# Altium schematic sheet Power_Sheet.SchDoc
size A4; SheetNumber: 1; SheetTotal: 4
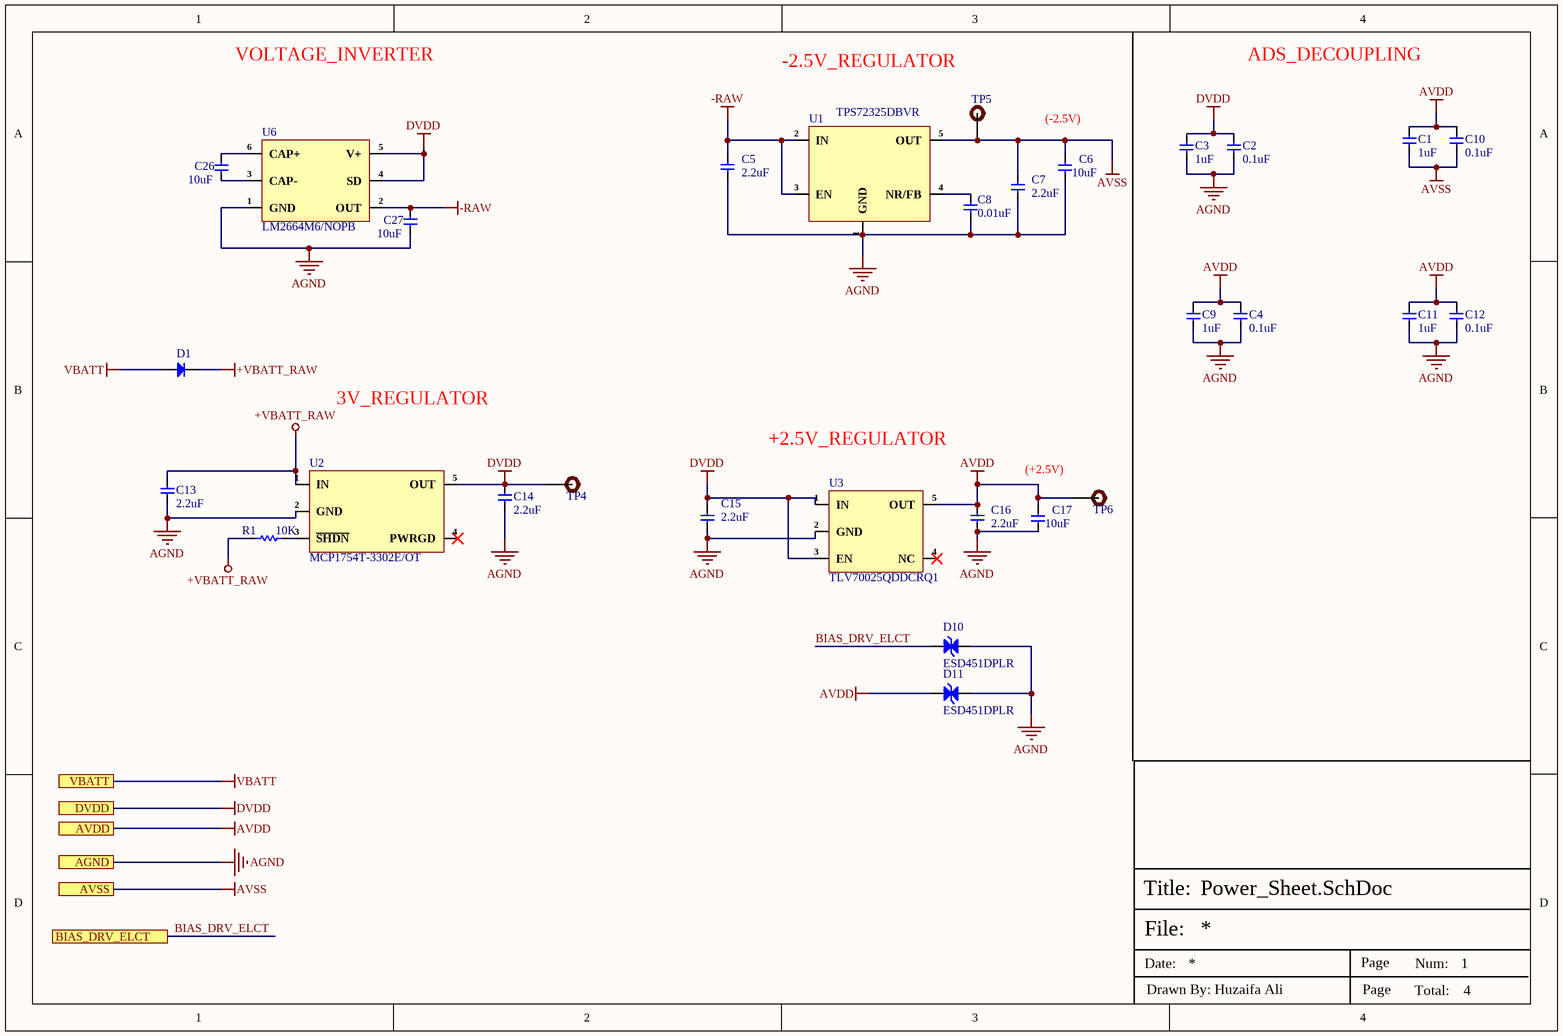
[diagram p0: Power_Sheet.SchDoc]

## Parts
C1  1uF  [Cap-0402]
C2  0.1uF  [Cap-0402]
C3  1uF  [Cap-0402]
C4  0.1uF  [Cap-0402]
C5  2.2uF  [Cap-0402]
C6  10uF  [Cap-0402]
C7  2.2uF  [Cap-0402]
C8  0.01uF  [Cap-0402]
C9  1uF  [Cap-0402]
C10  0.1uF  [Cap-0402]
C11  1uF  [Cap-0402]
C12  0.1uF  [Cap-0402]
C13  2.2uF  [Cap-0402]
C14  2.2uF  [Cap-0402]
C15  2.2uF  [Cap-0402]
C16  2.2uF  [Cap-0402]
C17  10uF  [Cap-0402]
C26  10uF  [Cap-0402]
C27  10uF  [Cap-0402]
D1  CDBU0130L  [CDBU0130L-HF]  (value not drawn)
D10  ESD451DPLR  [X2SON-2(0.3x0.6)]
D11  ESD451DPLR  [X2SON-2(0.3x0.6)]
R1  10K  [Res-0402]
TP4  TEST POINT 0.5mm Dia  [Test-point - 0.5mm]  (value not drawn)  (no BOM)
TP5  TEST POINT 0.5mm Dia  [Test-point - 0.5mm]  (value not drawn)  (no BOM)
TP6  TEST POINT 0.5mm Dia  [Test-point - 0.5mm]  (value not drawn)  (no BOM)
U1  TPS72325DBVR  [SOT-23-5]
U2  MCP1754T-3302E/OT  [SOT-23-5]
U3  TLV70025QDDCRQ1  [SOT-23-5]
U6  LM2664M6/NOPB  [SOT-23-6]

## Ports
AGND, AVDD, AVSS, BIAS_DRV_ELCT, DVDD, VBATT

## Nets
+VBATT_RAW: C13.1 D1.2(K) R1.1 U2.1(IN)
-RAW: C5.1 C27.2 U1.2(IN) U1.3(EN) U6.2(OUT)
AGND: C2.1 C3.1 C4.1 C5.2 C6.1 C7.2 C8.2 C9.1 C11.1 C12.1 C13.2 C14.2 C15.2 C16.2 C17.1 C27.1 D10.2(A) D11.2(A) U1.1(GND) U2.2(GND) U3.2(GND) U6.1(GND) ; port AGND
AVDD: C1.2 C4.2 C9.2 C10.2 C11.2 C12.2 C16.1 C17.2 D11.1(A) TP6.1 U3.5(OUT) ; port AVDD
AVSS: C1.1 C6.2 C7.1 C10.1 TP5.1 U1.5(OUT) ; port AVSS
DVDD: C2.2 C3.2 C14.1 C15.1 TP4.1 U2.5(OUT) U3.1(IN) U3.3(EN) U6.4(SD) U6.5(V+) ; port DVDD
VBATT: D1.1(A) ; port VBATT
BIAS_DRV_ELCT: D10.1(A) ; port BIAS_DRV_ELCT
NetC8_1: C8.1 U1.4(NR/FB)
NetC26_1: C26.1 U6.3(CAP-)
NetC26_2: C26.2 U6.6(CAP+)
NetR1_2: R1.2 U2.3(~{SHDN})

Not connected (* = marked no-connect by the designer): U2 4(PWRGD)*; U3 4(NC)*

## Notes on the sheet
- VOLTAGE_INVERTER
- -2.5V_REGULATOR
- ADS_DECOUPLING
- (near C6) (-2.5V)
- 3V_REGULATOR
- +2.5V_REGULATOR
- (+2.5V)
- File:
- Title:
- Date:
- Page
- Num:
- Total:
- Drawn By: Huzaifa Ali

## Library data of the parts
C1 C3 C9 C11 = CC0402KRX5R8BB105: CAP CER 1UF 25V X5R 0402; Manufacturer: Yageo; Tolerance: 10%; Supplier 1: Mouser; Manufacturer Part Number: CC0402KRX5R8BB105; RoHS: Yes; Category: Ceramic Capacitors; Stock 1: 91975; Pricing 1: 1=0.30000, 10=0.20400, 50=0.20400, 100=0.11600, 1000=0.07200, 10000=0.05900 (USD); Mount: Surface Mount; Case/Package: 0402; Case Code (Metric): 1005; Case Code (Imperial): 0402; Weight: 2.3E-05oz; Min Operating Temperature: -55°C; Max Operating Temperature: 85°C; Packaging: Tape and Reel; Capacitance: 1uF; Voltage Rating: 25V; Dielectric: X5R; Termination: SMD/SMT; Voltage Rating (DC): 25V; Package Quantity: 10000; Length: 0.039inch; Width: 0.02inch; Thickness: 0.022inch; Lead Free: Lead Free; Halogen Free: Halogen Free; RoHS Compliant: Yes; ComponentLink1URL: http://www.mouser.com/ds/2/447/Yageo_UPY-GP_NP0_16V-to-50V_9-358835.pdf?src-supplier=Mouser; ComponentLink1Description: http://www.mouser.com/ds/2/447/Yageo_UPY-GP_NP0_16V-to-50V_9-358835.pdf?src-supplier=Mouser; ComponentLink2URL: http://www.yageo.com/documents/recent/UPY-GPHC_X5R_4V-to-50V_25.pdf?src-supplier=Digi-Key; ComponentLink2Description: http://www.yageo.com/documents/recent/UPY-GPHC_X5R_4V-to-50V_25.pdf?src-supplier=Digi-Key; ComponentLink3URL: https://4donline.ihs.com/images/VipMasterIC/IC/YAGO/YAGO-S-A0006851646/YAGO-S-A0006851646-1.pdf?hkey=6D3A4C79FDBF58556ACFDE234799DDF0&src-supplier=Newark; ComponentLink3Description: https://4donline.ihs.com/images/VipMasterIC/IC/YAGO/YAGO-S-A0006851646/YAGO-S-A0006851646-1.pdf?hkey=6D3A4C79FDBF58556ACFDE234799DDF0&src-supplier=Newark; Supplier Part Number 1: 603-CC402KRX5R8BB105; LCSC Part Number: C326568
C2 C4 C10 C12 = CC0402KRX7R7BB104: CAP CER 0.1UF 16V X7R 0402; Manufacturer: Yageo; Item Type: Capacitors; Material: 4241ConductorMaterial; Tolerance: 10%; Value: 100nF; Temperature Coefficient: 30ppm/°C; Supplier: Future Electronics; LCSC Part Number: C60474; Manufacturer Part Number: CC0402KRX7R7BB104; RoHS: Yes; Stock: 22130000; Pricing: 10000=0.0021, 40000=0.002, 150000=0.0019, 250000=0.0019, 500000=0.0018 (USD); Mounting Technology: Surface Mount; Case/Package: 0402; Pins: 2; Case Code (Metric): 1005; Case Code (Imperial): 0402; Min Operating Temperature: -55°C; Max Operating Temperature: 125°C; Dielectric: X7R; Voltage Rating: 16V; Voltage Rating (DC): 16V; Packaging: Tape and Reel; Package Quantity: 1; Termination: SMD/SMT; Voltage: 16V; Series: CC; Voltage Rating (AC): 16V; Length: 1mm; Width: 0.02inch; Height: 0.5mm; Thickness: 0.022inch; Depth: 0.5mm; Radiation Hardening: No; RoHS Compliant: Yes; Reach SVHC Compliant: No; Halogen Free: 5694HalogenFree; Lead Free: 5697LeadFree; ComponentLink1URL: https://datasheet.ciiva.com/11788/0900766b80ce67ed-11788364.pdf?src-supplier=Rs; ComponentLink1Description: https://datasheet.ciiva.com/11788/0900766b80ce67ed-11788364.pdf?src-supplier=Rs; ComponentLink2URL: https://datasheet.ciiva.com/7978/1489800-7978111.pdf?src-supplier=Element14; ComponentLink2Description: https://datasheet.ciiva.com/7978/1489800-7978111.pdf?src-supplier=Element14; ComponentLink3URL: https://datasheet.ciiva.com/161/mlccorderingcode-161545.pdf?src-supplier=Digikey; ComponentLink3Description: https://datasheet.ciiva.com/161/mlccorderingcode-161545.pdf?src-supplier=Digikey; ComponentLink4URL: https://datasheet.ciiva.com/161/mlccorderingcode-161544.pdf?src-supplier=Digikey; ComponentLink4Description: https://datasheet.ciiva.com/161/mlccorderingcode-161544.pdf?src-supplier=Digikey; ComponentLink5URL: https://datasheet.ciiva.com/161/mlccorderingcode-161546.pdf?src-supplier=Digikey; ComponentLink5Description: https://datasheet.ciiva.com/161/mlccorderingcode-161546.pdf?src-supplier=Digikey; ComponentLink6URL: https://datasheet.ciiva.com/8033/1734573-8033661.pdf?src-supplier=Element14; ComponentLink6Description: https://datasheet.ciiva.com/8033/1734573-8033661.pdf?src-supplier=Element14; ComponentLink7URL: https://datasheet.ciiva.com/28450/1489800-28450335.pdf?src-supplier=Element14; ComponentLink7Description: https://datasheet.ciiva.com/28450/1489800-28450335.pdf?src-supplier=Element14; ComponentLink8URL: https://datasheet.ciiva.com/13395/upy-gphc-x7r-6-3v-to-50v-8-13395676.pdf?src-supplier=Mouser; ComponentLink8Description: https://datasheet.ciiva.com/13395/upy-gphc-x7r-6-3v-to-50v-8-13395676.pdf?src-supplier=Mouser; ComponentLink9URL: https://datasheet.ciiva.com/8033/1734573-8033663.pdf?src-supplier=Element14; ComponentLink9Description: https://datasheet.ciiva.com/8033/1734573-8033663.pdf?src-supplier=Element14; ComponentLink10URL: https://datasheet.ciiva.com/11587/upy-gphc-x7r-6-3v-to-50v-8-11587305.pdf?src-supplier=Avnet; ComponentLink10Description: https://datasheet.ciiva.com/11587/upy-gphc-x7r-6-3v-to-50v-8-11587305.pdf?src-supplier=Avnet
C5 C7 C13-C16 = C1005X5R1V225K050BC: CAP CER 2.2UF 35V X5R 0402; Manufacturer: TDK; Item Type: Capacitors; Dielectric Material: Ceramic; Material: 4241ConductorMaterial; Tolerance: 10%; Supplier: Digikey; Supplier Part Number: 445-9028-1-ND; Manufacturer Part Number: C1005X5R1V225K050BC; RoHS: Yes; Stock: 1458755; Pricing: 1=0.21, 10=0.123, 50=0.0866, 100=0.0754, 500=0.05646, 1000=0.05055, 2500=0.04429, 5000=0.04049 (USD); Mounting Technology: Surface Mount; Case/Package: 0402; Case Code (Imperial): 0402; Case Code (Metric): 1005; Weight: 2.3E-05oz; Min Operating Temperature: -55°C; Max Operating Temperature: 85°C; Packaging: Tape and Reel; Voltage Rating: 35V; Value: 2.2uF; Voltage Rating (DC): 35V; Package Quantity: 1; Dielectric: X5R; Termination: SMD/SMT; Series: C; Length: 1mm; Width: 0.02inch; Height: 0.5mm; Thickness: 0.022inch; Depth: 0.5mm; Lead Free: Lead Free; RoHS Compliant: Yes; Reach SVHC Compliant: Unknown; ComponentLink1URL: https://datasheet.ciiva.com/24218/mlcc-commercial-general-en-24218938.pdf?src-supplier=Mouser; ComponentLink1Description: https://datasheet.ciiva.com/24218/mlcc-commercial-general-en-24218938.pdf?src-supplier=Mouser
C6 C17 = CC0402MRX5R6BB106: CAP CER 10UF 10V X5R 0402; Manufacturer: Yageo; Tolerance: 20%; Item Type: Capacitor; Supplier 1: Future Electronics; Manufacturer Part Number: CC0402MRX5R6BB106; RoHS: Yes; Category: Ceramic Capacitors; Stock 1: 80000; Pricing 1: 10000=0.02650, 20000=0.02590, 30000=0.02550, 40000=0.02530, 50000=0.02450 (USD); Mount: Surface Mount; Case/Package: 0402; Case Code (Imperial): 0402; Case Code (Metric): 1005; Min Operating Temperature: -55°C; Max Operating Temperature: 85°C; Packaging: Tape and Reel; Capacitance: 10uF; Voltage Rating: 10V; RoHS Compliant: Yes; ComponentLink1URL: http://www.yageo.com/documents/recent/UPY-GPHC_X5R_4V-to-50V_25.pdf?src-supplier=Digi-Key; ComponentLink1Description: http://www.yageo.com/documents/recent/UPY-GPHC_X5R_4V-to-50V_25.pdf?src-supplier=Digi-Key; Supplier Part Number 1: 6097631; LCSC Part Number: C962143
C8 = CC0402KRX5R8BB103: CAP CER 10000PF 25V X5R 0402; Manufacturer: Yageo; Item Type: Capacitor; Supplier 1: Future Electronics; Manufacturer Part Number: CC0402KRX5R8BB103; RoHS: Yes; Category: Ceramic Capacitors; Stock 1: 140000; Pricing 1: 10000=0.00290, 40000=0.00270, 150000=0.00260, 250000=0.00250, 500000=0.00240 (USD); RoHS Compliant: Yes; Supplier Part Number 1: 2101932; LCSC Part Number: C576726; ComponentLink1Description: LCSC; ComponentLink1URL: https://www.lcsc.com/product-detail/Multilayer-Ceramic-Capacitors-MLCC-SMD-SMT_YAGEO-CC0402KRX5R8BB103_C576726.html
C26 C27 = CL05A106MP5NUNC: CAP CER 10UF 10V X5R 0402; Manufacturer: Samsung; Tolerance: 20%; Item Type: Capacitor; Supplier 1: Avnet; Manufacturer Part Number: CL05A106MP5NUNC; RoHS: Yes; Category: Ceramic Capacitors; Stock 1: 1729850; Pricing 1: 10000=0.02537 (USD); Mount: Surface Mount; Case/Package: 0402; Case Code (Metric): 1005; Case Code (Imperial): 0402; Contact Plating: Tin; Min Operating Temperature: -55°C; Max Operating Temperature: 85°C; Package Quantity: 1; Packaging: Tape and Reel; Capacitance: 10uF; Voltage Rating: 10V; Dielectric: X5R; Termination: Wraparound; Series: CL; Construction: Flat; Length: 1mm; Width: 0.02inch; Thickness: 0.028inch; Depth: 0.5mm; Radiation Hardening: No; Lead Free: Lead Free; RoHS Compliant: Yes; ComponentLink1URL: https://datasheet.ciiva.com/25721/cl05a106mp5nunc-25721584.pdf?src-supplier=Digi-Key; ComponentLink1Description: https://datasheet.ciiva.com/25721/cl05a106mp5nunc-25721584.pdf?src-supplier=Digi-Key; ComponentLink2URL: https://datasheet.ciiva.com/26838/getdatasheetpartid-745310-26838170.pdf?src-supplier=Verical; ComponentLink2Description: https://datasheet.ciiva.com/26838/getdatasheetpartid-745310-26838170.pdf?src-supplier=Verical; Supplier Part Number 1: CL05A106MP5NUNC; LCSC Part Number: C315248
D1 = CDBU0130L: DIODE SCHOTTKY 30V 100MA 0603C; Manufacturer: Comchip; Item Type: Diodes; Supplier: Digikey; LCSC Part Number: C2886023; Manufacturer Part Number: CDBU0130L; RoHS: Yes; Stock: 48706; Pricing: 1=0.32, 10=0.201, 100=0.1069, 500=0.09036, 1000=0.0802, 2000=0.07933 (USD); ComponentLink1URL: https://datasheet.ciiva.com/4716/cdbu0130l-reva791956-41311-4716064.pdf?src-supplier=Mouser; ComponentLink1Description: https://datasheet.ciiva.com/4716/cdbu0130l-reva791956-41311-4716064.pdf?src-supplier=Mouser; ComponentLink2URL: https://datasheet.ciiva.com/912/cdbu0130l-reva791956-912529.pdf?src-supplier=Digikey; ComponentLink2Description: https://datasheet.ciiva.com/912/cdbu0130l-reva791956-912529.pdf?src-supplier=Digikey; ComponentLink3URL: https://datasheet.ciiva.com/912/cdbu0130l-reva791956-912530.pdf?src-supplier=Digikey; ComponentLink3Description: https://datasheet.ciiva.com/912/cdbu0130l-reva791956-912530.pdf?src-supplier=Digikey; ComponentLink4URL: https://datasheet.ciiva.com/912/cdbu0130l-reva791956-912531.pdf?src-supplier=Digikey; ComponentLink4Description: https://datasheet.ciiva.com/912/cdbu0130l-reva791956-912531.pdf?src-supplier=Digikey
D10 D11 = ESD451DPLR: TVS DIODE 5.5VWM 9.5VC 2X2SON; Manufacturer: Texas Instruments; Supplier: Mouser; LCSC Part Number: C22427500; Manufacturer Part Number: ESD451DPLR; RoHS: No; Item Type: Diode; Pricing: 1=0.2, 10=0.192, 50=0.192, 100=0.164, 1000=0.147, 10000=0.068 (USD); Pins: 2; Length: 600um; Width: 300um; Height: 320um; Thickness: 300um
R1 = RT0402BRD0710KL: RES SMD 10K OHM 0.1% 1/16W 0402; Manufacturer: Yageo; Item Type: Resistor; Supplier: Future Electronics; Supplier Part Number: 1236728; Manufacturer Part Number: RT0402BRD0710KL; RoHS: Yes; Category: Chip SMD Resistors; Stock: 490000; Pricing: 10000=0.0218, 20000=0.0213, 30000=0.021, 50000=0.0206, 100000=0.0199 (USD); ComponentLink1URL: https://datasheet.ciiva.com/12836/pyu-rt-1-to-0-05-rohs-l-4-12836454.pdf?src-supplier=Mouser; ComponentLink1Description: https://datasheet.ciiva.com/12836/pyu-rt-1-to-0-05-rohs-l-4-12836454.pdf?src-supplier=Mouser; LCSC Part Number: C190095
TP4-TP6 = TEST POINT 0.5mm Dia: Test Point ON; Item Type: Test Point; Manufacturer Part Number: TEST POINT 0.5mm Dia
U1 = TPS72325DBVR: IC REG LIN -2.5V 200MA SOT23-5; Manufacturer: Texas Instruments; Number of Outputs: 1; Max Power Dissipation: 560mW; Dropout Voltage: 280mV; Max Supply Voltage: -2.7V; Min Input Voltage: -10V; Min Current Limit: 300mA; Input Bias Current: 130uA; Polarity: Negative; Accuracy: 2%; Output Type: Fixed; Supplier: Mouser; LCSC Part Number: C69932; Manufacturer Part Number: TPS72325DBVR; RoHS: Yes; Item Type: IC; Stock: 2906; Pricing: 1=2.91, 10=1.99, 50=1.99, 100=1.79, 1000=1.59, 10000=1.49 (USD); Case/Package: SOT-23; Pins: 5; Min Operating Temperature: -40°C; Max Operating Temperature: 125°C; Packaging: Tape and Reel; Output Voltage: -2.5V; Package Quantity: 3000; Output Current: 200mA; Max Output current: 200mA; Number of Regulators: 1; Min Output Voltage: -2.5V; Quiescent Current: 130uA; Max Output Voltage: -2.5V; Series: -; Nominal Output Voltage: -2.5V; Radiation Hardening: No; Lead Free: Lead Free; RoHS Compliant: Yes; Reach SVHC Compliant: No; ComponentLink1URL: http://www.mouser.com/ds/2/405/slvs346c-521947.pdf?src-supplier=Mouser; ComponentLink1Description: http://www.mouser.com/ds/2/405/slvs346c-521947.pdf?src-supplier=Mouser; ComponentLink2URL: http://components.arrow.com/part/dataview/40177093S9611537N7713?src-supplier=Arrow+Electronics; ComponentLink2Description: http://components.arrow.com/part/dataview/40177093S9611537N7713?src-supplier=Arrow+Electronics; ComponentLink3URL: http://www.ti.com/general/docs/lit/getliterature.tsp?genericPartNumber=TPS723&amp;&amp;fileType=pdf&src-supplier=Farnell; ComponentLink3Description: http://www.ti.com/general/docs/lit/getliterature.tsp?genericPartNumber=TPS723&amp;&amp;fileType=pdf&src-supplier=Farnell; ComponentLink4URL: http://www.ti.com/general/docs/lit/getliterature.tsp?genericPartNumber=TPS723&amp;&amp;fileType=pdf&src-supplier=Element14; ComponentLink4Description: http://www.ti.com/general/docs/lit/getliterature.tsp?genericPartNumber=TPS723&amp;&amp;fileType=pdf&src-supplier=Element14; ComponentLink5URL: http://www.ti.com/lit/ds/symlink/tps723.pdf?src-supplier=Digikey; ComponentLink5Description: http://www.ti.com/lit/ds/symlink/tps723.pdf?src-supplier=Digikey; ComponentLink6URL: http://www.ti.com/general/docs/suppproductinfo.tsp?distId=10&amp;gotoUrl=http%3A%2F%2Fwww.ti.com%2Flit%2Fgpn%2Ftps723&src-supplier=Digikey; ComponentLink6Description: http://www.ti.com/general/docs/suppproductinfo.tsp?distId=10&amp;gotoUrl=http%3A%2F%2Fwww.ti.com%2Flit%2Fgpn%2Ftps723&src-supplier=Digikey; ComponentLink7URL: http://www.ti.com/general/docs/lit/getliterature.tsp?genericPartNumber=TPS723&amp;&amp;fileType=pdf&src-supplier=Newark; ComponentLink7Description: http://www.ti.com/general/docs/lit/getliterature.tsp?genericPartNumber=TPS723&amp;&amp;fileType=pdf&src-supplier=Newark; ComponentLink8URL: http://www.ti.com/general/docs/lit/getliterature.tsp?genericPartNumber=TPS723&&fileType=pdf&src-supplier=Avnet; ComponentLink8Description: http://www.ti.com/general/docs/lit/getliterature.tsp?genericPartNumber=TPS723&&fileType=pdf&src-supplier=Avnet
U2 = MCP1754T-3302E/OT: IC REG LINEAR 3.3V 150MA SOT23-5; Manufacturer: Microchip; Max Supply Voltage: 16V; Number of Regulators: 1; Quiescent Current: 90uA; Output Type: Fixed; Output Configuration: Positive; Max Supply Current: 250uA; Power Supply Rejection Ratio (PSRR): 72dB; Dropout Voltage: 300mV; Min Input Voltage: 3.6V; Accuracy: 2%; Supplier: Arrow Electronics; LCSC Part Number: C295712; Manufacturer Part Number: MCP1754T-3302E/OT; RoHS: Yes; Item Type: IC; Stock: 5987; Pricing: 1=0.5022, 10=0.4946, 25=0.487, 100=0.4793, 250=0.4717, 500=0.4641, 1000=0.4565, 3000=0.4488 (USD); Case/Package: SOT-23-5; Pins: 5; Min Operating Temperature: -40°C; Max Operating Temperature: 150°C; Packaging: Tape and Reel; Output Current: 150mA; Series: -; Min Output Voltage: 3.3V; Output Voltage: 3.3V; Number of Outputs: 1; Max Output current: 150mA; Polarity: Positive; Radiation Hardening: No; Lead Free: Lead Free; RoHS Compliant: Yes; ComponentLink1URL: https://datasheet.ciiva.com/26947/getdatasheetpartid-769851-26947956.pdf?src-supplier=Verical; ComponentLink1Description: https://datasheet.ciiva.com/26947/getdatasheetpartid-769851-26947956.pdf?src-supplier=Verical; ComponentLink2URL: https://datasheet.ciiva.com/13012/22276a-79238-13012583.pdf?src-supplier=Mouser; ComponentLink2Description: https://datasheet.ciiva.com/13012/22276a-79238-13012583.pdf?src-supplier=Mouser; ComponentLink3URL: https://datasheet.ciiva.com/8238/22276a-8238678.pdf?src-supplier=Avnet; ComponentLink3Description: https://datasheet.ciiva.com/8238/22276a-8238678.pdf?src-supplier=Avnet; ComponentLink4URL: https://datasheet.ciiva.com/2056/22276a-2056672.pdf?src-supplier=Digikey; ComponentLink4Description: https://datasheet.ciiva.com/2056/22276a-2056672.pdf?src-supplier=Digikey
U3 = TLV70025QDDCRQ1: IC REG LINEAR 2.5V 200MA SOT23; Manufacturer: Texas Instruments; Supplier: Mouser; LCSC Part Number: C2867307; Manufacturer Part Number: TLV70025QDDCRQ1; RoHS: Yes; Item Type: IC; Stock: 2425; Pricing: 1=0.65, 10=0.41, 50=0.41, 100=0.334, 1000=0.306, 10000=0.269 (USD); ComponentLink1URL: https://datasheet.ciiva.com/29568/tlv70025-q1-29568375.pdf?src-supplier=Digikey; ComponentLink1Description: https://datasheet.ciiva.com/29568/tlv70025-q1-29568375.pdf?src-supplier=Digikey; ComponentLink2URL: https://datasheet.ciiva.com/12958/slvsa61c-120807-12958385.pdf?src-supplier=Mouser; ComponentLink2Description: https://datasheet.ciiva.com/12958/slvsa61c-120807-12958385.pdf?src-supplier=Mouser
U6 = LM2664M6/NOPB: IC REG CHRG PUMP INV 40MA SOT23; Manufacturer: TI National Semiconductor; Max Supply Voltage: 5.5V; Min Supply Voltage: 1.8V; Output Voltage: -5.5V; Number of Outputs: 1; Frequency: 160kHz; Max Power Dissipation: 600mW; Switching Frequency: 80kHz; Logic Function: Inverting; Max Output Voltage: -1.8V; Topology: Buck-Boost,Charge Pump; Output Type: Fixed,Adjustable; Synchronous Rectifier: No; Supply Current: 500uA; Number of Channels: 1NUMBER; Output Power: 500mW; Supplier: Mouser; LCSC Part Number: C840095; Manufacturer Part Number: LM2664M6/NOPB; RoHS: Yes; Item Type: IC; Stock: 36504; Pricing: 1=0.95, 10=0.616, 50=0.616, 100=0.507, 1000=0.467, 10000=0.422 (USD); Mounting Technology: Surface Mount; Case/Package: SOT-23; Pins: 6; Min Operating Temperature: -40°C; Max Operating Temperature: 85°C; Packaging: Tape and Reel; Output Current: 40mA; Min Input Voltage: 1.8V; Max Output current: 40mA; Package Quantity: 1000; Min Output Voltage: -5.5V; Termination: SMD/SMT; Series: -; Length: 2.92mm; Width: 1.6mm; Height: 1.02mm; Thickness: 1.2mm; Radiation Hardening: No; Reach SVHC Compliant: No; Lead Free: 5697LeadFree; ComponentLink1URL: https://datasheet.ciiva.com/22669/1811104-22669560.pdf?src-supplier=Element14; ComponentLink1Description: https://datasheet.ciiva.com/22669/1811104-22669560.pdf?src-supplier=Element14; ComponentLink2URL: https://datasheet.ciiva.com/27055/1992911-27055843.pdf?src-supplier=Jameco; ComponentLink2Description: https://datasheet.ciiva.com/27055/1992911-27055843.pdf?src-supplier=Jameco; ComponentLink3URL: https://datasheet.ciiva.com/1641/1703149-1641090.pdf?src-supplier=Newark; ComponentLink3Description: https://datasheet.ciiva.com/1641/1703149-1641090.pdf?src-supplier=Newark; ComponentLink4URL: https://datasheet.ciiva.com/15114/getdatasheetpartid-117448-15114290.pdf?src-supplier=Verical; ComponentLink4Description: https://datasheet.ciiva.com/15114/getdatasheetpartid-117448-15114290.pdf?src-supplier=Verical; ComponentLink5URL: https://datasheet.ciiva.com/5699/1853535-5699178.pdf?src-supplier=Farnell; ComponentLink5Description: https://datasheet.ciiva.com/5699/1853535-5699178.pdf?src-supplier=Farnell